# Altium project Dark_Tag.PrjPcb (part 1 of 2)
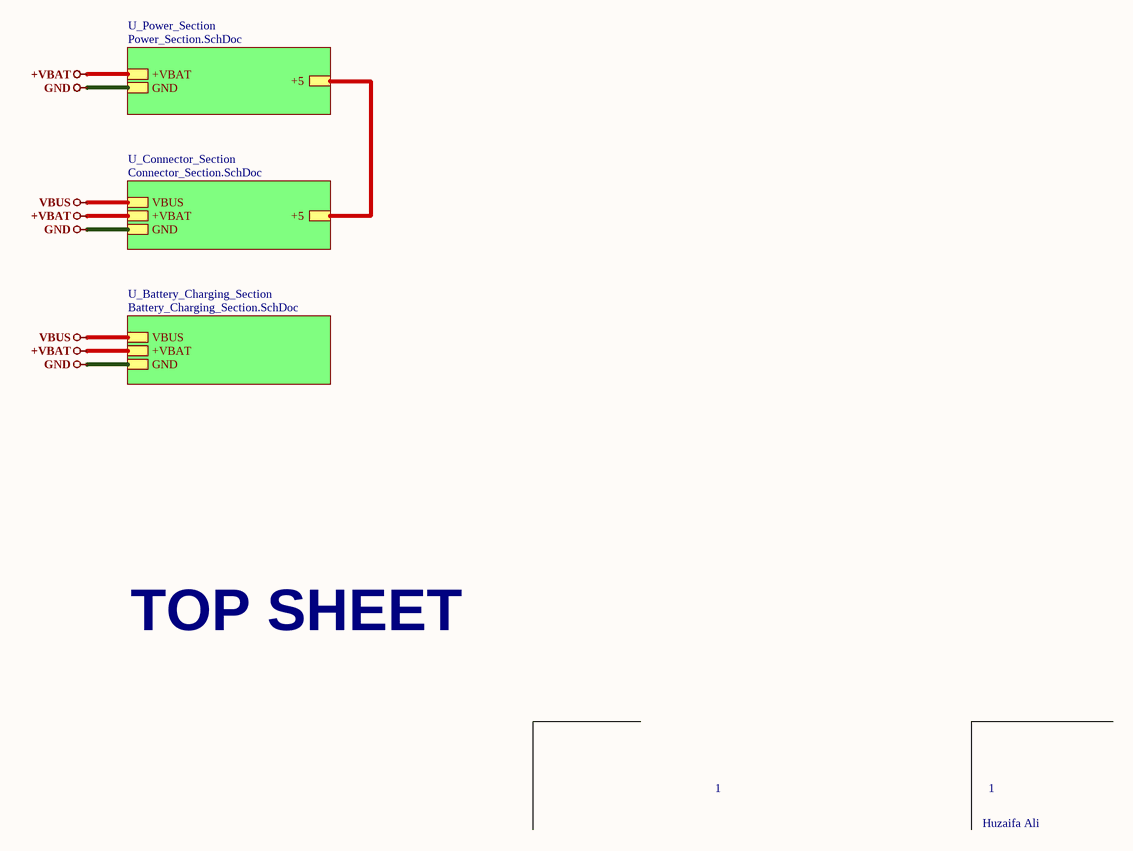
[diagram p0: Top_Sheet.SchDoc]
4 sheets, 61 parts. Net scope: hierarchical (ports join the sheet entries above them; power ports are global).
Board file: DT.PcbDoc
Sheets:
  Top_Sheet.SchDoc
    U_Power_Section = Power_Section.SchDoc
    U_Connector_Section = Connector_Section.SchDoc
    U_Battery_Charging_Section = Battery_Charging_Section.SchDoc

## Sheet Top_Sheet.SchDoc: =Projectname
size A4; SheetNumber: 1; SheetTotal: 4

### Sub-sheets
U_Battery_Charging_Section = Battery_Charging_Section.SchDoc: GND, VBUS, +VBAT
U_Connector_Section = Connector_Section.SchDoc: GND, +5, VBUS, +VBAT
U_Power_Section = Power_Section.SchDoc: +VBAT, GND, +5

### Nets
+5: sheet U_Power_Section/+5, sheet U_Connector_Section/+5
+VBAT: sheet U_Power_Section/+VBAT, sheet U_Connector_Section/+VBAT, sheet U_Battery_Charging_Section/+VBAT
GND: sheet U_Power_Section/GND, sheet U_Connector_Section/GND, sheet U_Battery_Charging_Section/GND
VBUS: sheet U_Connector_Section/VBUS, sheet U_Battery_Charging_Section/VBUS  [project net C_VCC]

### Notes on the sheet
- TOP SHEET
- 1
- Huzaifa Ali

## Sheet Power_Section.SchDoc: =Projectname
size A4; SheetNumber: 4; SheetTotal: 4
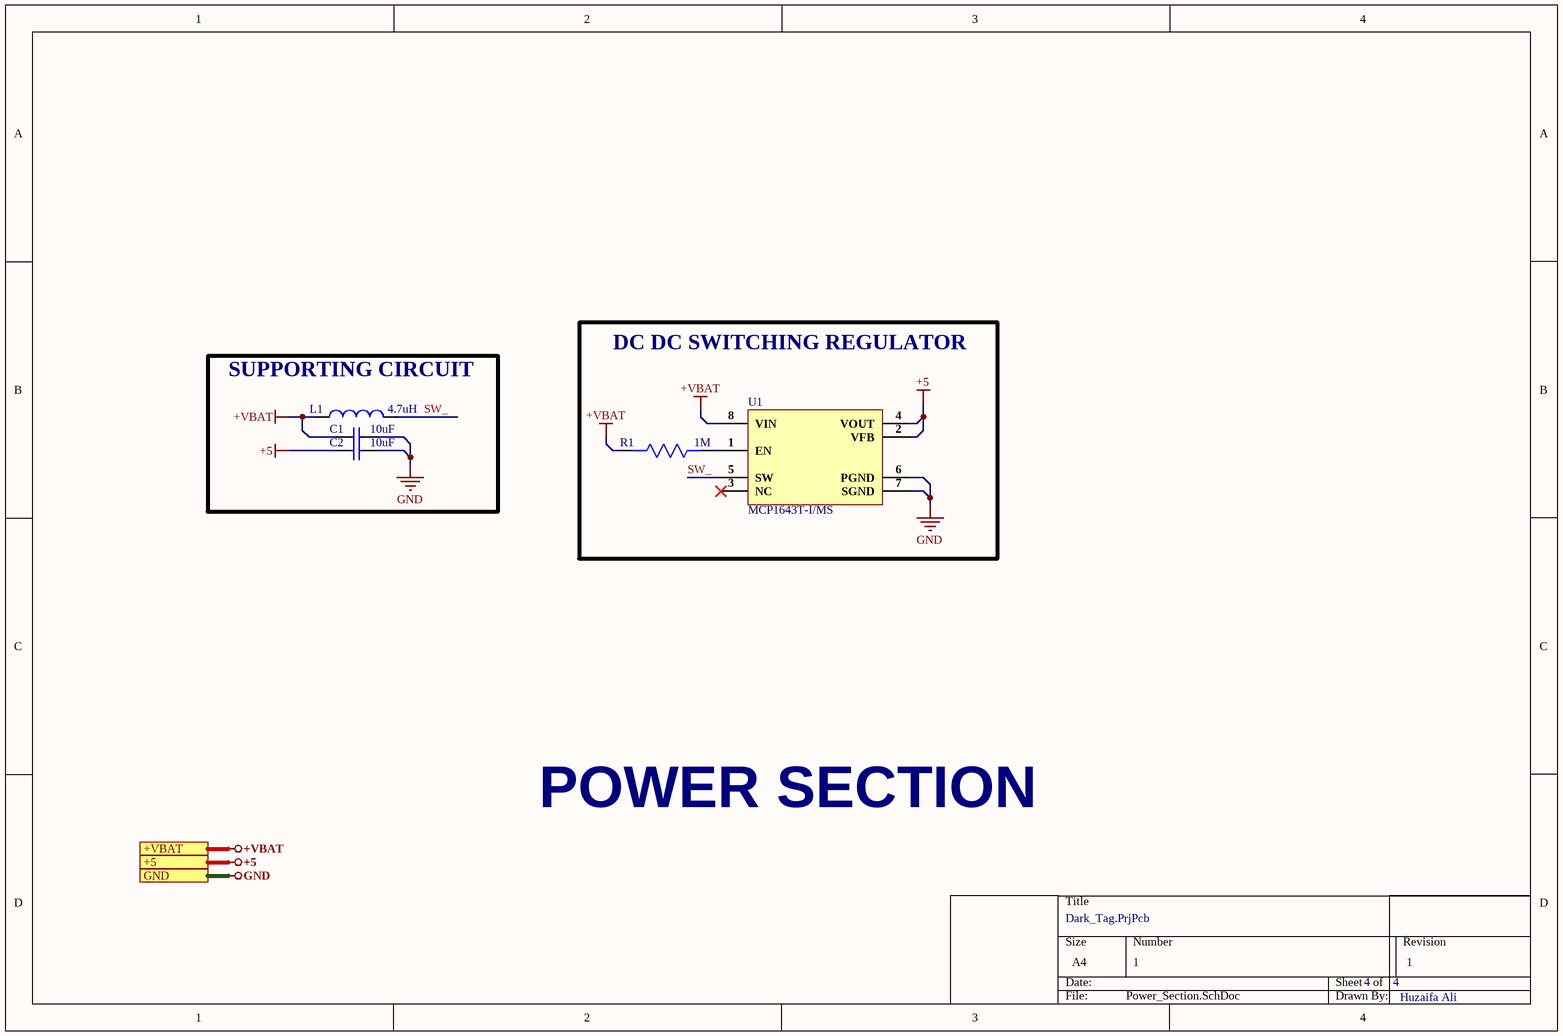
[diagram p1: Power_Section.SchDoc]

### Parts
C1  10uF  [Cap0805]
C2  10uF  [Cap0805]
L1  4.7uH  [SRN5020-4R7M]
R1  1M  [Res0402]
U1  MCP1643T-I/MS  [8-MSOP]

### Blocks framed on the sheet
DC DC SWITCHING REGULATOR: R1 U1
SUPPORTING CIRCUIT: C1 C2 L1

### Ports
+5, +VBAT, GND

### Nets
+5: C2.1 U1.2(VFB) U1.4(VOUT) ; port +5
+VBAT: C1.1 L1.1 R1.2 U1.8(VIN) ; port +VBAT
GND: C1.2 C2.2 U1.6(PGND) U1.7(SGND) ; port GND
SW_: L1.2 U1.5(SW)
NetR1_1: R1.1 U1.1(EN)

Not connected (* = marked no-connect by the designer): U1 3(NC)*

### Notes on the sheet
- POWER SECTION
- 1
- Huzaifa Ali

### Library data of the parts
C1 C2 = TMK212BBJ106KGHT: CAP CER 10UF 25V X5R 0805; Manufacturer: Taiyo Yuden; Tolerance: 10%; Supplier 1: Newark; Manufacturer Part Number: TMK212BBJ106KGHT; RoHS: Yes; Category: Ceramic Capacitors; Stock 1: 26354; Pricing 1: 1=0.06100, 25=0.06100, 50=0.06100, 100=0.06100, 250=0.06100, 500=0.05600 (USD); Mount: Surface Mount; Case/Package: 0805; Case Code (Metric): 2012; Case Code (Imperial): 0805; Weight: 0.000194oz; Min Operating Temperature: -55°C; Max Operating Temperature: 85°C; Capacitance: 10uF; Packaging: Tape and Reel; Voltage Rating: 25V; Dielectric: X5R; Termination: SMD/SMT; Voltage Rating (DC): 25V; Package Quantity: 3000; Length: 0.079inch; Width: 0.049inch; Height: 1.25mm; Thickness: 0.053inch; Ratings: AEC-Q200; RoHS Compliant: Yes; ComponentLink1URL: http://www.mouser.com/ds/2/396/mlcc11_hq_e-541564.pdf?src-supplier=Mouser; ComponentLink1Description: http://www.mouser.com/ds/2/396/mlcc11_hq_e-541564.pdf?src-supplier=Mouser; ComponentLink2URL: https://www.yuden.co.jp/productdata/catalog/mlcc_all_hq_e.pdf?src-supplier=Digi-Key; ComponentLink2Description: https://www.yuden.co.jp/productdata/catalog/mlcc_all_hq_e.pdf?src-supplier=Digi-Key; ComponentLink3URL: http://ds.yuden.co.jp/TYCOMPAS/ut/detail.do?productNo=TMK212BBJ106KGHT&fileName=TMK212BBJ106KGHT_SS&mode=specSheetDownload&src-supplier=Digi-Key; ComponentLink3Description: http://ds.yuden.co.jp/TYCOMPAS/ut/detail.do?productNo=TMK212BBJ106KGHT&fileName=TMK212BBJ106KGHT_SS&mode=specSheetDownload&src-supplier=Digi-Key; ComponentLink4URL: http://ds.yuden.co.jp/TYCOMPAS/ut/detail.do?productNo=TMK212BBJ106KGHT&dataUnit=M&src-supplier=Avnet; ComponentLink4Description: http://ds.yuden.co.jp/TYCOMPAS/ut/detail.do?productNo=TMK212BBJ106KGHT&dataUnit=M&src-supplier=Avnet; Supplier Part Number 1: 95Y2170
L1 = SRN5020-4R7M: FIXED IND 4.7UH 2A 72 MOHM SMD; Manufacturer: Bourns; Material: Steel; Core Material: Ferrite; DC Resistance (DCR): 72mR; Self Resonant Frequency: 30MHz; Test Frequency: 100kHz; Tolerance: 20%; Shielding: Shielded; Supplier 1: Mouser; Manufacturer Part Number: SRN5020-4R7M; RoHS: Yes; Category: Fixed Inductors; Stock 1: 12; Pricing 1: 1=0.55000, 10=0.38000, 50=0.38000, 100=0.32900, 250=0.30900, 500=0.27900, 1000=0.23400, 2000=0.22700, 10000=0.22700 (USD); Mount: Surface Mount; Case/Package: 2020; Number of Pins: 2; Min Operating Temperature: -25°C; Max Operating Temperature: 120°C; Resistor Type: Wirewound; Max DC Current: 2A; Termination: SMD/SMT; DC Current: 2A; RMS Current (Irms): 2A; Package Quantity: 2000; Current Rating: 2A; Saturation Current: 2A; Packaging: Cut Tape; Inductance Tolerance: 20%; Inductance: 4.7uH; Length: 5mm; Width: 5mm; Height: 2mm; Height - Seated (Max): 0.079inch; Depth: 5.2mm; REACH SVHC: No SVHC; Military Standard: Not; ComponentLink1URL: https://datasheet.ciiva.com/46451/1684090-46451208.pdf?src-supplier=Element14; ComponentLink1Description: https://datasheet.ciiva.com/46451/1684090-46451208.pdf?src-supplier=Element14; ComponentLink2URL: https://datasheet.ciiva.com/17111/70255680-17111900.pdf?src-supplier=Allied+Electronics; ComponentLink2Description: https://datasheet.ciiva.com/17111/70255680-17111900.pdf?src-supplier=Allied+Electronics; ComponentLink3URL: https://datasheet.ciiva.com/6689/srn5020-6689167.pdf?src-supplier=Digi-Key; ComponentLink3Description: https://datasheet.ciiva.com/6689/srn5020-6689167.pdf?src-supplier=Digi-Key; ComponentLink4URL: https://datasheet.ciiva.com/13168/srn5020-13168591.pdf?src-supplier=Mouser; ComponentLink4Description: https://datasheet.ciiva.com/13168/srn5020-13168591.pdf?src-supplier=Mouser; ComponentLink5URL: https://datasheet.ciiva.com/22717/1684090-22717782.pdf?src-supplier=Element14; ComponentLink5Description: https://datasheet.ciiva.com/22717/1684090-22717782.pdf?src-supplier=Element14; Supplier Part Number 1: 652-SRN5020-4R7M
R1 = AF0402FR-071ML: RES SMD 1M OHM 1% 1/16W 0402; Manufacturer: Yageo; Resistance: 1MR; Max Power Dissipation: 63mW; Temperature Coefficient: 100ppm/°C; Supplier 1: Mouser; Manufacturer Part Number: AF0402FR-071ML; RoHS: Yes; Category: Chip SMD Resistors; Stock 1: 35543; Pricing 1: 1=0.12000, 10=0.06300, 50=0.06300, 100=0.02600, 1000=0.01200, 10000=0.00700 (USD); Case/Package: 0402; Min Operating Temperature: -55°C; Max Operating Temperature: 155°C; Packaging: Tape and Reel; Resistor Type: Thick Film; Number of Terminations: 2; Tolerance: 1%; Features: Moisture Resistant,Anti-Sulfur; Length: 0.039inch; Width: 0.02inch; Height: 0.015inch; RoHS Compliant: Yes; ComponentLink1URL: http://www.yageo.com/documents/recent/PYu-AF_51_RoHS_L_5.pdf?src-supplier=Digi-Key; ComponentLink1Description: http://www.yageo.com/documents/recent/PYu-AF_51_RoHS_L_5.pdf?src-supplier=Digi-Key; Supplier Part Number 1: 603-AF0402FR-071ML
U1 = MCP1643T-I/MS: IC LED DRV RGLTR PWM 550MA 8MSOP; Manufacturer: Microchip; Number of Outputs: 1; Frequency: 1MHz; Max Supply Voltage: 5V; Topology: Boost; Supplier 1: Mouser; Manufacturer Part Number: MCP1643T-I/MS; RoHS: Yes; Category: LED Drivers; Stock 1: 22; Pricing 1: 1=1.33000, 10=1.33000, 50=1.12000, 100=1.02000, 1000=1.02000, 10000=1.02000 (USD); Mount: Surface Mount; Case/Package: MSOP; Weight: 0.004938oz; Min Operating Temperature: -40°C; Max Operating Temperature: 85°C; Packaging: Tape and Reel; Package Quantity: 2500; Output Current per Channel: 550mA; Output Current: 550mA; Output Voltage: 5V; Switching Frequency: 1MHz; Dimming: PWM; RoHS Compliant: Yes; ComponentLink1URL: http://www.mouser.com/ds/2/268/20005208A-708734.pdf?src-supplier=Mouser; ComponentLink1Description: http://www.mouser.com/ds/2/268/20005208A-708734.pdf?src-supplier=Mouser; ComponentLink2URL: http://www.microchip.com/mymicrochip/filehandler.aspx?ddocname=en565730&src-supplier=Digi-Key; ComponentLink2Description: http://www.microchip.com/mymicrochip/filehandler.aspx?ddocname=en565730&src-supplier=Digi-Key; Supplier Part Number 1: 579-MCP1643T-I/MS

## Sheet Connector_Section.SchDoc: =Projectname
size A4; SheetNumber: 2; SheetTotal: 4
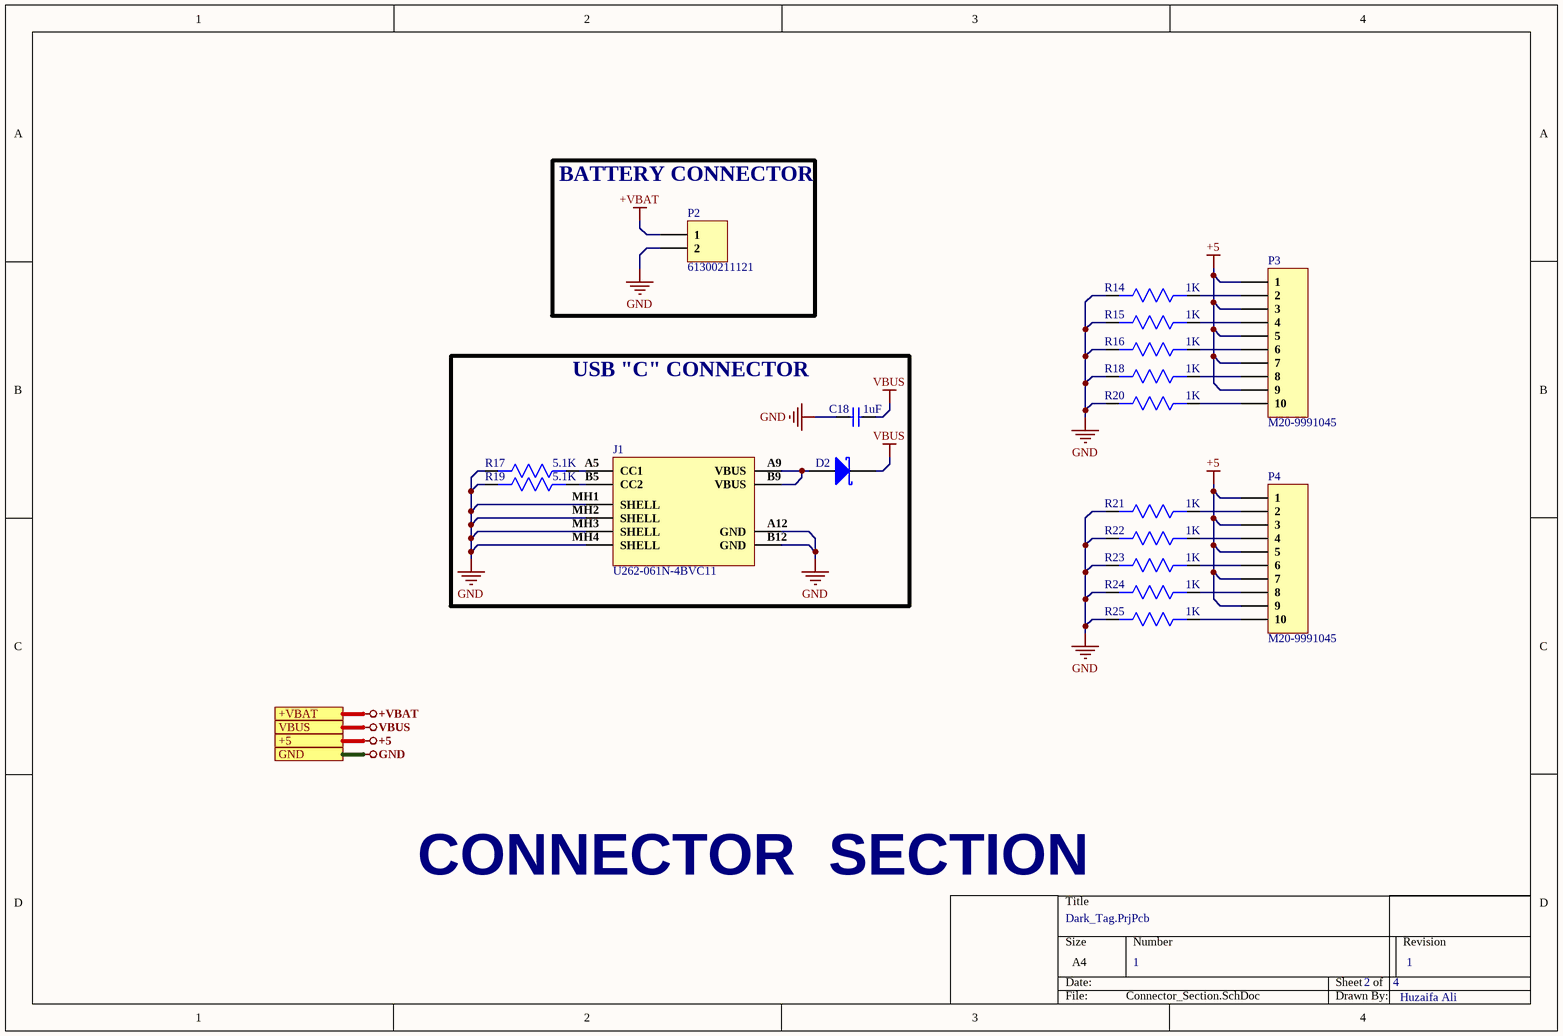
[diagram p2: Connector_Section.SchDoc]

### Parts
C18  1uF  [Cap0805]
D2  SK56A-LTP  [SMA]  (value not drawn)
J1  U262-061N-4BVC11  [U262-061N-4BVC11]
P2  61300211121  [HDR1X2]
P3  M20-9991045  [HDR1X10]
P4  M20-9991045  [HDR1X10]
R14  1K  [Res0402]
R15  1K  [Res0402]
R16  1K  [Res0402]
R17  5.1K  [Res0603]
R18  1K  [Res0402]
R19  5.1K  [Res0603]
R20  1K  [Res0402]
R21  1K  [Res0402]
R22  1K  [Res0402]
R23  1K  [Res0402]
R24  1K  [Res0402]
R25  1K  [Res0402]

### Blocks framed on the sheet
BATTERY CONNECTOR: P2
USB "C" CONNECTOR: C18 D2 J1 R17 R19

### Ports
+5, +VBAT, GND, VBUS

### Nets
+5: P3.1 P3.3 P3.5 P3.7 P3.9 P4.1 P4.3 P4.5 P4.7 P4.9 ; port +5
+VBAT: P2.1 ; port +VBAT
GND: C18.1 J1.A12(GND) J1.B12(GND) J1.MH1(SHELL) J1.MH2(SHELL) J1.MH3(SHELL) J1.MH4(SHELL) P2.2 R14.2 R15.2 R16.2 R17.1 R18.2 R19.1 R20.2 R21.2 R22.2 R23.2 R24.2 R25.2 ; port GND
VBUS: C18.2 D2.1(K) ; port VBUS  [project net C_VCC]
NetD2_2: D2.2(A) J1.A9(VBUS) J1.B9(VBUS)
NetJ1_A5: J1.A5(CC1) R17.2
NetJ1_B5: J1.B5(CC2) R19.2
NetP3_2: P3.2 R14.1
NetP3_4: P3.4 R15.1
NetP3_6: P3.6 R16.1
NetP3_8: P3.8 R18.1
NetP3_10: P3.10 R20.1
NetP4_2: P4.2 R21.1
NetP4_4: P4.4 R22.1
NetP4_6: P4.6 R23.1
NetP4_8: P4.8 R24.1
NetP4_10: P4.10 R25.1

### Notes on the sheet
- CONNECTOR  SECTION
- 1
- Huzaifa Ali

### Library data of the parts
C18 = GCM21BR71E105KA56L: CAP CER 1UF 25V X7R 0805; Manufacturer: Murata; Tolerance: 10%; Supplier 1: Arrow Electronics; Manufacturer Part Number: GCM21BR71E105KA56L; RoHS: Yes; Category: Ceramic Capacitors; Stock 1: 120000; Pricing 1: 3000=0.07110, 6000=0.06620, 12000=0.05840 (USD); Mount: Surface Mount; Case/Package: 0805; Case Code (Metric): 2012; Case Code (Imperial): 0805; Min Operating Temperature: -55°C; Max Operating Temperature: 125°C; Capacitance: 1uF; Dielectric: X7R; Package Quantity: 3000; Voltage Rating: 25V; Packaging: Tape and Reel; Termination: SMD/SMT; Voltage: 25V; Voltage Rating (DC): 25V; Series: GCM; Construction: Flat; Length: 2mm; Width: 0.049inch; Height: 1.25mm; Thickness: 0.055inch; Depth: 1.25mm; Ratings: AEC-Q200; Radiation Hardening: No; REACH SVHC: No SVHC; Lead Free: Lead Free; RoHS Compliant: Yes; ComponentLink1URL: https://datasheet.ciiva.com/137/product-137199.pdf?src-supplier=Digi-Key; ComponentLink1Description: https://datasheet.ciiva.com/137/product-137199.pdf?src-supplier=Digi-Key; ComponentLink2URL: https://datasheet.ciiva.com/11789/0900766b80ef92d0-11789092.pdf?src-supplier=RSComponents; ComponentLink2Description: https://datasheet.ciiva.com/11789/0900766b80ef92d0-11789092.pdf?src-supplier=RSComponents; ComponentLink3URL: https://datasheet.ciiva.com/3778/359gcm21br71e105ka5623-3778560.pdf?src-supplier=Arrow+Electronics; ComponentLink3Description: https://datasheet.ciiva.com/3778/359gcm21br71e105ka5623-3778560.pdf?src-supplier=Arrow+Electronics; ComponentLink4URL: https://datasheet.ciiva.com/18183/getdatasheetpartid-153106-18183696.pdf?src-supplier=Verical; ComponentLink4Description: https://datasheet.ciiva.com/18183/getdatasheetpartid-153106-18183696.pdf?src-supplier=Verical; ComponentLink5URL: https://datasheet.ciiva.com/137/product-137200.pdf?src-supplier=Digi-Key; ComponentLink5Description: https://datasheet.ciiva.com/137/product-137200.pdf?src-supplier=Digi-Key; ComponentLink6URL: https://datasheet.ciiva.com/137/product-137201.pdf?src-supplier=Digi-Key; ComponentLink6Description: https://datasheet.ciiva.com/137/product-137201.pdf?src-supplier=Digi-Key; ComponentLink7URL: https://datasheet.ciiva.com/2989/product-2989245.pdf?src-supplier=Avnet; ComponentLink7Description: https://datasheet.ciiva.com/2989/product-2989245.pdf?src-supplier=Avnet; ComponentLink8URL: https://datasheet.ciiva.com/2989/product-2989246.pdf?src-supplier=Avnet; ComponentLink8Description: https://datasheet.ciiva.com/2989/product-2989246.pdf?src-supplier=Avnet; Supplier Part Number 1: GCM21BR71E105KA56L
D2 = SK56A-LTP: DIODE SCHOTTKY 5A 60V SMA; Manufacturer: MCC; Supplier 1: Arrow Electronics; Manufacturer Part Number: SK56A-LTP; RoHS: Yes; Category: Rectifier Diodes; Stock 1: 4792; Pricing 1: 1=0.50900, 10=0.41320, 100=0.28100, 500=0.21080, 1000=0.15810, 2000=0.14490, 5000=0.13610, 10000=0.12730, 25000=0.11980 (USD); Mount: Surface Mount; Case/Package: SMA; Packaging: Tape and Reel; Average Rectified Current: 5A; Max Reverse Voltage (DC): 60V; RoHS Compliant: Yes; ComponentLink1URL: http://www.mccsemi.com/up_pdf/SK52A-L-SK510A-L(DO-214AC).pdf?src-supplier=Digi-Key; ComponentLink1Description: http://www.mccsemi.com/up_pdf/SK52A-L-SK510A-L(DO-214AC).pdf?src-supplier=Digi-Key; Supplier Part Number 1: SK56A-LTP
J1 = U262-061N-4BVC11: USB 3.1 1 Surface Mount 6 Female -25℃~+85℃ Type-C SMD USB Connectors ROHS; Manufacturer: XKB; Manufacturer Part Number: U262-061N-4BVC11; Footprint: Custom; ComponentLink1Description: LCSC; ComponentLink1URL: https://www.lcsc.com/product-detail/span-style-background-color-ff0-USB-span-Connectors_XKB-Connectivity-U262-061N-4BVC11_C2764612.html
P2 = 61300211121: CONN HEADER VERT 2POS 2.54MM; Manufacturer: Wurth Electronics; Current Rating: 3A; Voltage Rating: 250V; Number of Positions: 2; Gender: Male; Connector Type: Male Pin; Pitch: 0.1inch; Supplier 1: Digi-Key; Manufacturer Part Number: 61300211121; Stock 1: 219205; Pricing 1: 1=0.13, 10=0.106, 25=0.088, 50=0.074, 100=0.067, 1000=0.061 (USD); Mount: Through Hole; Contact Plating: Gold; Housing Material: PBT; Contact Material: Copper Alloy,Copper; Color: Black; Min Operating Temperature: -40°C; Max Operating Temperature: 125°C; Number of Rows: 1; Contact Gender: Male; Packaging: Bulk; Termination: Through Hole; Number of Contacts: 2; Contact Mating Length: 0.236inch; REACH SVHC: Unknown; Lead Free: Lead Free; ComponentLink1URL: http://www.mouser.com/ds/2/445/6130xx11121-538006.pdf?src-supplier=Mouser; ComponentLink1Description: http://www.mouser.com/ds/2/445/6130xx11121-538006.pdf?src-supplier=Mouser; Supplier Part Number 1: 732-5315-ND
P3 P4 = M20-9991045: CONN HEADER VERT 10POS 2.54MM; Manufacturer: Harwin; Number of Contacts: 10; Max Current Rating: 3A; Contact Resistance: 25mR; Gender: Male; Insulation Resistance: 10GR; Connector Type: Male Pin; Supplier 1: Digi-Key; Manufacturer Part Number: M20-9991045; Stock 1: 1623; Pricing 1: 1=0.44, 10=0.413, 100=0.2891, 500=0.2478, 1000=0.2065, 5000=0.177, 10000=0.1652 (USD); Mount: Through Hole; Case/Package: SIL; Weight: 0.020459oz; Color: Black; Contact Plating: Gold; Contact Material: Brass,Bronze; Housing Color: Black; Housing Material: Nylon; Min Operating Temperature: -40°C; Max Operating Temperature: 105°C; Number of Rows: 1; Termination: Solder; Packaging: Bulk; Current Rating: 3A; Package Quantity: 500; Number of Positions: 10; Orientation: Straight; Length: 25.4mm; Height: 0.125inch; Width: 0.5inch; Pitch: 2.54mm; Contact Mating Length: 0.24inch; Depth: 2.54mm; Radiation Hardening: No; REACH SVHC: No SVHC; ComponentLink1URL: http://www.mouser.com/ds/2/181/Harwin_Product_Catalog_page_206-1134556.pdf?src-supplier=Mouser; ComponentLink1Description: http://www.mouser.com/ds/2/181/Harwin_Product_Catalog_page_206-1134556.pdf?src-supplier=Mouser; ComponentLink2URL: http://www.farnell.com/cad/689114.pdf?src-supplier=Element14; ComponentLink2Description: http://www.farnell.com/cad/689114.pdf?src-supplier=Element14; Supplier Part Number 1: 952-1842-ND
R14-R16 R18 R20-R25 = AF0402FR-071KL: RES SMD 1K OHM 1% 1/16W 0402; Manufacturer: Yageo; Resistance: 1kR; Max Power Dissipation: 63mW; Temperature Coefficient: 100ppm/°C; ComponentLink1URL: http://www.yageo.com/documents/recent/PYu-AT_51_RoHS_L_5.pdf?src-supplier=Digi-Key; ComponentLink1Description: http://www.yageo.com/documents/recent/PYu-AT_51_RoHS_L_5.pdf?src-supplier=Digi-Key; Supplier 1: Arrow Electronics; Manufacturer Part Number: AF0402FR-071KL; RoHS: Yes; Category: Chip SMD Resistors; Stock 1: 60000; Pricing 1: 10000=0.00560 (USD); Case/Package: 0402; Min Operating Temperature: -55°C; Max Operating Temperature: 155°C; Packaging: Tape and Reel; Resistor Type: Thick Film; Number of Terminations: 2; Tolerance: 1%; Features: Moisture Resistant,Anti-Sulfur; Length: 0.039inch; Width: 0.02inch; Height: 0.015inch; RoHS Compliant: Yes; ComponentLink2URL: http://www.yageo.com/documents/recent/PYu-AF_51_RoHS_L_5.pdf?src-supplier=Digi-Key; ComponentLink2Description: http://www.yageo.com/documents/recent/PYu-AF_51_RoHS_L_5.pdf?src-supplier=Digi-Key; Supplier Part Number 1: AF0402FR-071KL
R17 R19 = RMCF0603JT5K10: RES 5.1K OHM 5% 1/10W 0603; Manufacturer: Stackpole Electronics; Resistance: 5.1kR; Power Rating: 100mW; Temperature Coefficient: 200ppm/°C; Supplier 1: Arrow Electronics; Manufacturer Part Number: RMCF0603JT5K10; RoHS: Yes; Category: Chip SMD Resistors; Stock 1: 335000; Pricing 1: 5000=0.00190, 10000=0.00160, 25000=0.00140, 50000=0.00120 (USD); Mount: Surface Mount; Case/Package: 0603; Case Code (Metric): 1608; Case Code (Imperial): 0603; Contact Plating: Tin,Matte; Size Code: 0603; Min Operating Temperature: -55°C; Max Operating Temperature: 155°C; Tolerance: 5%; Packaging: Tape and Reel; Package Quantity: 5000; Resistor Type: Thick Film; Number of Terminations: 2; Max Power Dissipation: 100mW; Features: Automotive AEC-Q200; Series: RMCF; Construction: Rectangular; Length: 1.55mm; Width: 0.031inch; Height: 0.022inch; Depth: 0.8mm; Radiation Hardening: No; Military Standard: Not; Lead Free: Lead Free; RoHS Compliant: Yes; ComponentLink1URL: https://www.verical.com/server-webapp/html/getDatasheet?partID=542786&src-supplier=Verical; ComponentLink1Description: https://www.verical.com/server-webapp/html/getDatasheet?partID=542786&src-supplier=Verical; ComponentLink2URL: http://components.arrow.com/part/dataview/40962028S7515679N1174?src-supplier=Arrow+Electronics; ComponentLink2Description: http://components.arrow.com/part/dataview/40962028S7515679N1174?src-supplier=Arrow+Electronics; ComponentLink3URL: https://www.seielect.com/catalog/sei-rmcf_rmcp.pdf?src-supplier=Digi-Key; ComponentLink3Description: https://www.seielect.com/catalog/sei-rmcf_rmcp.pdf?src-supplier=Digi-Key; ComponentLink4URL: https://www.seielect.com/catalog/SEI-RMCF_RMCP.pdf?src-supplier=Avnet; ComponentLink4Description: https://www.seielect.com/catalog/SEI-RMCF_RMCP.pdf?src-supplier=Avnet; ComponentLink5URL: http://www.seielect.com/catalog/sei-rmc.pdf?src-supplier=Future+Electronics; ComponentLink5Description: http://www.seielect.com/catalog/sei-rmc.pdf?src-supplier=Future+Electronics; Supplier Part Number 1: RMCF0603JT5K10